# EAGLE design 572pv1 (EAGLE 6.4)
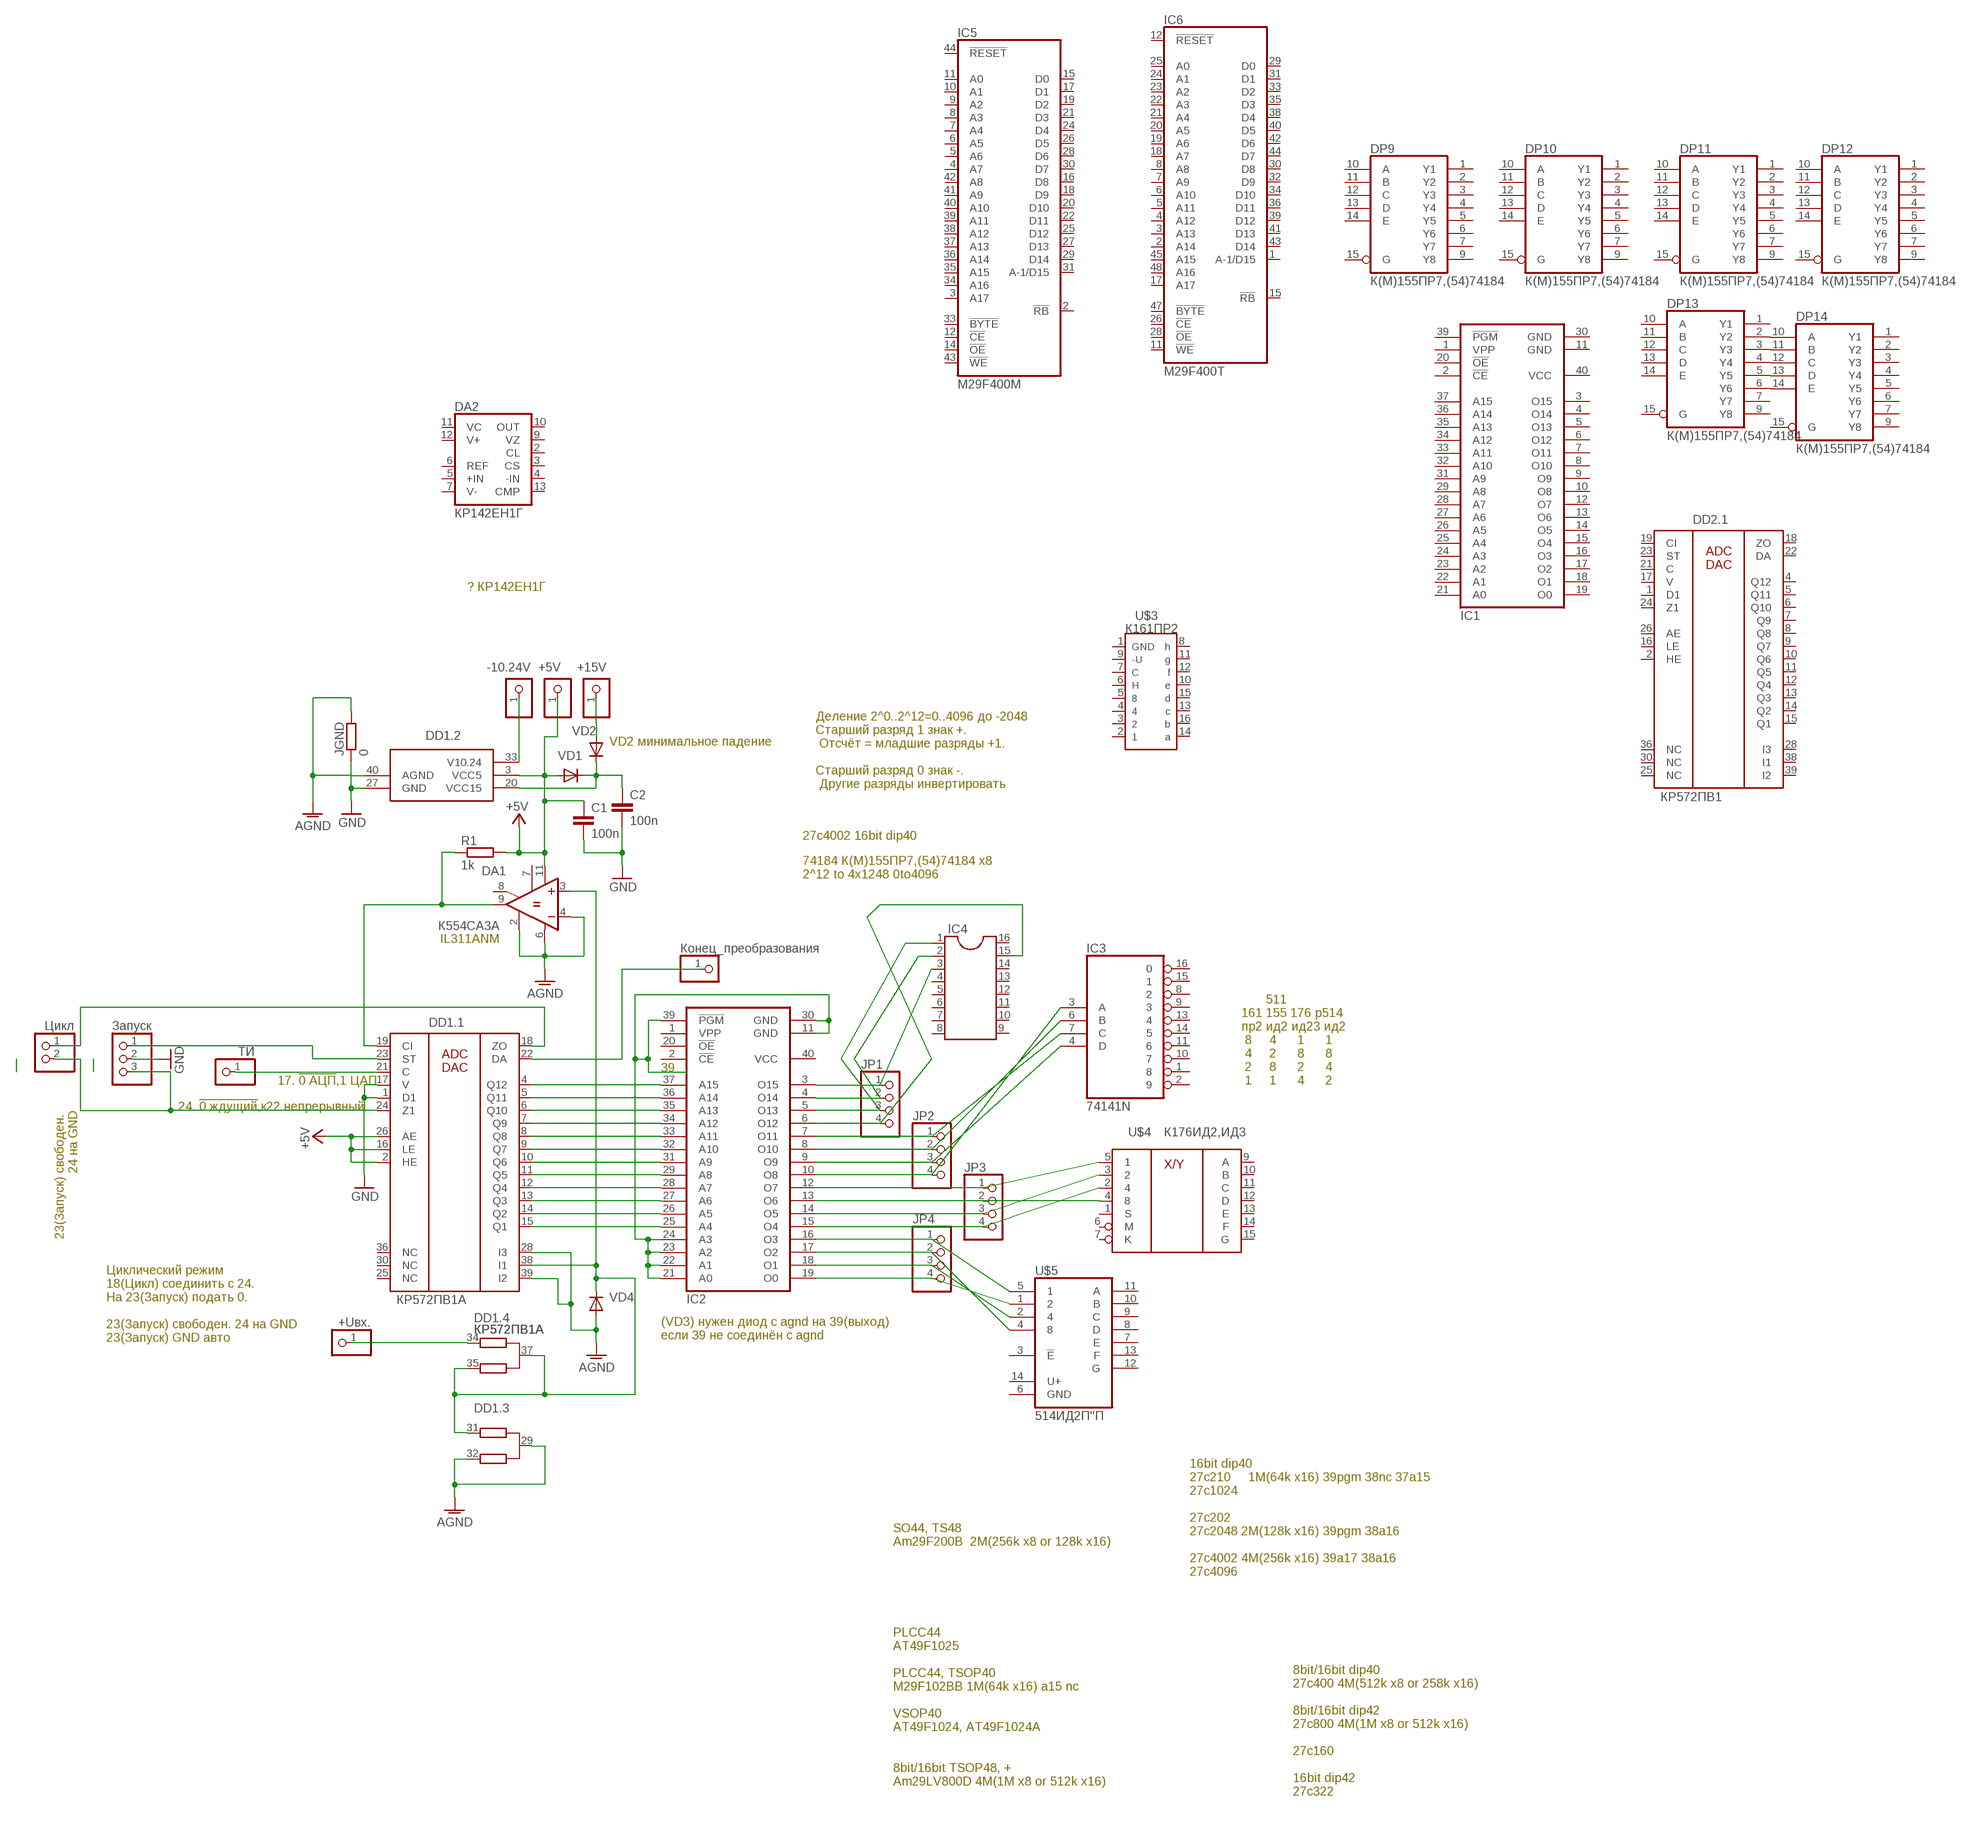
[diagram p0: schematic, sheet 1, part 1 of 2]
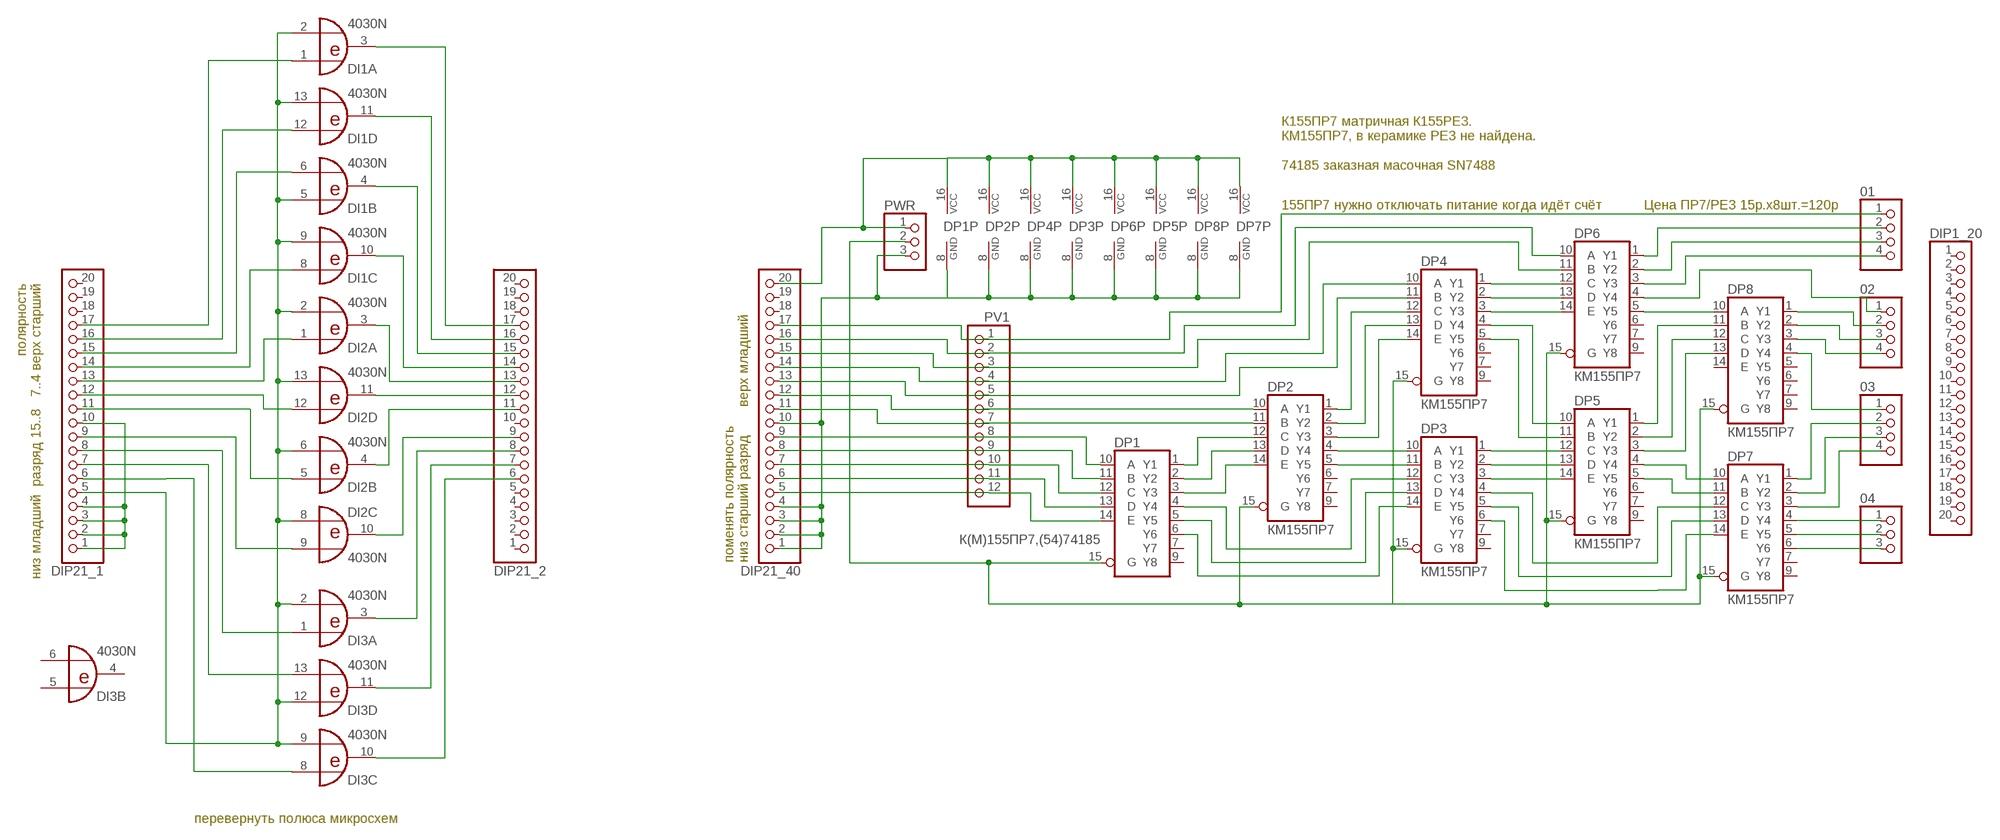
[diagram p1: schematic, sheet 1, part 2 of 2]

## Parts
01  PINHD-1X4  [1X04]
02  PINHD-1X4  [1X04]
03  PINHD-1X4  [1X04]
04  PINHD-1X3  [1X03]
+5V  PINHD-1X1  [1X01]
+15V  PINHD-1X1  [1X01]
+Uвх.  PINHD-1X1  [1X01]
-10.24V  PINHD-1X1  [1X01]
C1  100n  C-EUC0805  [C0805]
C2  100n  C-EUC0805  [C0805]
DA1  К554СА3А  LM311,К554СА3KY  [DIL14]
DA2  КР142ЕН1Г  UA723N  [DIL14]
DD1  КР572ПВ1А  КР572ПВ1  [DIL40]
DD2  КР572ПВ1  [DIL40]
DI1  4030N  [DIL14]
DI2  4030N  [DIL14]
DI3  4030N  [DIL14]
DIP1_20  PINHD-1X20  [1X20]
DIP21_1  PINHD-1X20  [1X20]
DIP21_2  PINHD-1X20  [1X20]
DIP21_40  PINHD-1X20  [1X20]
DP1  К(М)155ПР7,(54)74185  74184N  [DIL16]
DP2  КМ155ПР7  74184N  [DIL16]
DP3  КМ155ПР7  74184N  [DIL16]
DP4  КМ155ПР7  74184N  [DIL16]
DP5  КМ155ПР7  74184N  [DIL16]
DP6  КМ155ПР7  74184N  [DIL16]
DP7  КМ155ПР7  74184N  [DIL16]
DP8  КМ155ПР7  74184N  [DIL16]
DP9  К(М)155ПР7,(54)74184  74184N  [DIL16]
DP10  К(М)155ПР7,(54)74184  74184N  [DIL16]
DP11  К(М)155ПР7,(54)74184  74184N  [DIL16]
DP12  К(М)155ПР7,(54)74184  74184N  [DIL16]
DP13  К(М)155ПР7,(54)74184  74184N  [DIL16]
DP14  К(М)155ПР7,(54)74184  74184N  [DIL16]
IC1  27210  [DIL40]
IC2  27210  [DIL40]
IC3  74141N  [DIL16]
IC4  DIL16  [DIL16]
IC5  M29F400M  [SO44]
IC6  M29F400T  [TSOP48]
JGND  0  R-EU_R0805  [R0805]
JP1  PINHD-1X4  [1X04]
JP2  PINHD-1X4  [1X04]
JP3  PINHD-1X4  [1X04]
JP4  PINHD-1X4  [1X04]
PV1  PINHD-1X12  [1X12]
PWR  PINHD-1X3  [1X03]
R1  1k  R-EU_R0805  [R0805]
U$3  К161ПР2  [238.16-1]
U$4  К176ИД2,ИД3  [DIL16B]
U$5  514ИД2П''П  [238.14-1]
VD1  DIODE-SOD80C  [SOD80C]
VD2  DIODE-SOD80C  [SOD80C]
VD4  DIODE-SOD80C  [SOD80C]
Запуск  PINHD-1X3  [1X03]
Конец_преобразования  PINHD-1X1  [1X01]
ТИ  PINHD-1X1  [1X01]
Цикл  PINHD-1X2/2  [1X02]

## Nets
+5V: +5V.1 C1.1 DA1.11(V+) DD1.2(.1:HE) DD1.3(.2:VCC5) DD1.16(.1:LE) DD1.26(.1:AE) R1.2 VD1.A
AGND: DA1.2(GND) DA1.4(-IN) DA1.6(V-) DD1.28(.1:I3) DD1.29(.3:R2) DD1.32(.3:R1B) DD1.39(.1:I2) DD1.40(.2:AGND) JGND.2 VD4.A
GND: C1.2 C2.2 DD1.1(.1:D1) DD1.17(.1:V) DD1.27(.2:GND) JGND.1 Запуск.2
N$1: IC2.11(GND) IC2.21(A0) IC2.22(A1) IC2.23(A2) IC2.24(A3) IC2.30(GND) IC2.39(!PGM)
N$2: DD1.4(.1:Q12) IC2.37(A15)
N$3: C2.1 DD1.20(.2:VCC15) VD1.C VD2.C
N$4: DD1.5(.1:Q11) IC2.36(A14)
N$5: DD1.6(.1:Q10) IC2.35(A13)
N$6: DA1.3(+IN) DD1.31(.3:R1A) DD1.35(.4:R1B) DD1.37(.4:R2) DD1.38(.1:I1) VD4.C
N$7: DD1.7(.1:Q9) IC2.34(A12)
N$8: DD1.8(.1:Q8) IC2.33(A11)
N$9: DD1.9(.1:Q7) IC2.32(A10)
N$10: DD1.10(.1:Q6) IC2.31(A9)
N$11: DD1.11(.1:Q5) IC2.29(A8)
N$12: DD1.12(.1:Q4) IC2.28(A7)
N$13: DD1.13(.1:Q3) IC2.27(A6)
N$14: DD1.14(.1:Q2) IC2.26(A5)
N$15: DD1.15(.1:Q1) IC2.25(A4)
N$16: DIP21_40.9 DP1.10(A) PV1.8
N$17: DP13.2(Y2) DP14.10(A)
N$18: IC2.4(O14) IC4.2 JP1.2
N$19: IC2.3(O15) IC4.3 JP1.1
N$20: +Uвх..1 DD1.34(.4:R1A)
N$21: IC2.7(O11) IC3.7(C) JP2.1
N$22: IC2.8(O10) IC3.6(B) JP2.2
N$23: IC2.9(O9) IC3.4(D) JP2.3
N$24: IC2.10(O8) IC3.3(A) JP2.4
N$25: IC2.12(O7) JP3.1 U$4.5
N$26: IC2.13(O6) JP3.2 U$4.4
N$27: IC2.14(O5) JP3.3 U$4.3
N$28: IC2.15(O4) JP3.4 U$4.2
N$29: IC2.16(O3) JP4.1 U$5.5
N$30: IC2.17(O2) JP4.2 U$5.4
N$31: IC2.18(O1) JP4.3 U$5.2
N$32: IC2.19(O0) JP4.4 U$5.1
N$33: DIP21_40.8 DP1.11(B) PV1.9
N$34: DIP21_40.7 DP1.12(C) PV1.10
N$35: DIP21_40.6 DP1.13(D) PV1.11
N$36: DIP21_40.5 DP1.14(E) PV1.12
N$37: DP1.1(Y1) DP2.12(C)
N$38: DP1.2(Y2) DP2.13(D)
N$39: DP1.3(Y3) DP2.14(E)
N$40: DIP21_40.11 DP2.11(B) PV1.7
N$41: DIP21_40.12 DP2.10(A) PV1.6
N$42: DP2.4(Y4) DP3.10(A)
N$43: DP2.5(Y5) DP3.11(B)
N$44: DP1.4(Y4) DP3.12(C)
N$45: DP1.5(Y5) DP3.13(D)
N$46: DP1.6(Y6) DP3.14(E)
N$47: DP2.3(Y3) DP4.14(E)
N$48: DP2.2(Y2) DP4.13(D)
N$49: DP2.1(Y1) DP4.12(C)
N$50: DIP21_40.13 DP4.11(B) PV1.5
N$51: DIP21_40.14 DP4.10(A) PV1.4
N$52: DP3.1(Y1) DP5.12(C)
N$53: DP3.2(Y2) DP5.13(D)
N$54: DP3.3(Y3) DP5.14(E)
N$55: DP4.5(Y5) DP5.11(B)
N$56: DP4.4(Y4) DP5.10(A)
N$57: DP4.3(Y3) DP6.14(E)
N$58: DP4.2(Y2) DP6.13(D)
N$59: DP4.1(Y1) DP6.12(C)
N$60: DP3.4(Y4) DP7.12(C)
N$61: DP3.5(Y5) DP7.13(D)
N$62: DP3.6(Y6) DP7.14(E)
N$63: DP5.3(Y3) DP8.13(D)
N$64: DP5.5(Y5) DP7.11(B)
N$65: DP5.4(Y4) DP7.10(A)
N$66: DP5.1(Y1) DP8.11(B)
N$67: DP5.2(Y2) DP8.12(C)
N$68: DP6.5(Y5) DP8.10(A)
N$69: 04.1 DP7.4(Y4)
N$70: 04.2 DP7.5(Y5)
N$71: 04.3 DP7.6(Y6)
N$72: 03.2 DP7.1(Y1)
N$73: 03.3 DP7.2(Y2)
N$74: 03.4 DP7.3(Y3)
N$75: 03.1 DP8.4(Y4)
N$76: 02.3 DP8.2(Y2)
N$77: 02.2 DP8.1(Y1)
N$78: 02.4 DP8.3(Y3)
N$79: DIP21_40.15 DP6.11(B) PV1.3
N$80: DIP21_40.16 DP6.10(A) PV1.2
N$81: 01.1 DIP21_40.17 PV1.1
N$82: 02.1 DP6.4(Y4)
N$83: 01.4 DP6.3(Y3)
N$84: 01.3 DP6.2(Y2)
N$85: 01.2 DP6.1(Y1)
N$86: DIP21_40.1 DIP21_40.2 DIP21_40.3 DIP21_40.4 DIP21_40.10 DP1.8(GND) DP2.8(GND) DP3.8(GND) DP4.8(GND) DP5.8(GND) DP6.8(GND) DP7.8(GND) DP8.8(GND) PWR.3
N$87: DP1.15(G) DP2.15(G) DP3.15(G) DP4.15(G) DP5.15(G) DP6.15(G) DP7.15(G) DP8.15(G) PWR.2
N$88: -10.24V.1 DD1.33(.2:V10.24)
N$89: IC2.6(O12) IC4.15 JP1.4
N$90: DIP21_40.20 DP1.16(VCC) DP2.16(VCC) DP3.16(VCC) DP4.16(VCC) DP5.16(VCC) DP6.16(VCC) DP7.16(VCC) DP8.16(VCC) PWR.1
N$91: IC2.5(O13) IC4.1 JP1.3
N$92: DD1.23(.1:ST) Запуск.1
N$93: DA1.9(OUT) DD1.19(.1:CI) R1.1
N$94: DD1.21(.1:C) ТИ.1
N$95: DD1.22(.1:DA) Конец_преобразования.1
N$96: DP13.3(Y3) DP14.11(B)
N$97: +15V.1 VD2.A
N$98: DP13.4(Y4) DP14.12(C)
N$99: DD1.24(.1:Z1) Запуск.3 Цикл.2
N$101: DD1.18(.1:ZO) Цикл.1
N$102: DP13.5(Y5) DP14.13(D)
N$103: DP13.6(Y6) DP14.14(E)
N$104: DI2.11(D:O) DIP21_2.12
N$105: DI2.12(D:I0) DIP21_1.12
N$106: DI2.5(B:I0) DIP21_1.11
N$107: DI1.8(C:I0) DIP21_1.14
N$108: DI1.6(B:I1) DIP21_1.15
N$109: DI1.12(D:I0) DIP21_1.16
N$110: DI1.1(A:I0) DIP21_1.17
N$111: DI2.9(C:I1) DIP21_1.9
N$112: DI3.1(A:I0) DIP21_1.8
N$113: DI3.13(D:I1) DIP21_1.7
N$114: DI3.8(C:I0) DIP21_1.6
N$115: DI2.3(A:O) DIP21_2.13
N$116: DI2.1(A:I0) DIP21_1.13
N$117: DIP21_1.1 DIP21_1.2 DIP21_1.3 DIP21_1.4 DIP21_1.10
N$118: DI1.2(A:I1) DI1.5(B:I0) DI1.9(C:I1) DI1.13(D:I1) DI2.2(A:I1) DI2.6(B:I1) DI2.8(C:I0) DI2.13(D:I1) DI3.2(A:I1) DI3.9(C:I1) DI3.12(D:I0) DIP21_1.5
N$119: DI1.10(C:O) DIP21_2.14
N$120: DI1.4(B:O) DIP21_2.15
N$121: DI1.11(D:O) DIP21_2.16
N$122: DI1.3(A:O) DIP21_2.17
N$123: DI2.4(B:O) DIP21_2.11
N$124: DI2.10(C:O) DIP21_2.9
N$125: DI3.3(A:O) DIP21_2.8
N$126: DI3.11(D:O) DIP21_2.7
N$127: DI3.10(C:O) DIP21_2.6
Unconnected: DA1.7(ON) DA1.8(ON/STR) DA2.2(CL) DA2.3(CS) DA2.4(-IN) DA2.5(+IN) DA2.6(REF) DA2.7(V-) DA2.9(VZ) DA2.10(OUT) DA2.11(VC) DA2.12(V+) DA2.13(CMP) DD1.25(.1:NC) DD1.30(.1:NC) DD1.36(.1:NC) DD2.1(.1:D1) DD2.2(.1:HE) DD2.4(.1:Q12) DD2.5(.1:Q11) DD2.6(.1:Q10) DD2.7(.1:Q9) DD2.8(.1:Q8) DD2.9(.1:Q7) DD2.10(.1:Q6) DD2.11(.1:Q5) DD2.12(.1:Q4) DD2.13(.1:Q3) DD2.14(.1:Q2) DD2.15(.1:Q1) DD2.16(.1:LE) DD2.17(.1:V) DD2.18(.1:ZO) DD2.19(.1:CI) DD2.21(.1:C) DD2.22(.1:DA) DD2.23(.1:ST) DD2.24(.1:Z1) DD2.25(.1:NC) DD2.26(.1:AE) DD2.28(.1:I3) DD2.29(.3:R2) DD2.30(.1:NC) DD2.31(.3:R1A) DD2.32(.3:R1B) DD2.34(.4:R1A) DD2.35(.4:R1B) DD2.36(.1:NC) DD2.37(.4:R2) DD2.38(.1:I1) DD2.39(.1:I2) DI3.4(B:O) DI3.5(B:I0) DI3.6(B:I1) DIP1_20.1 DIP1_20.2 DIP1_20.3 DIP1_20.4 DIP1_20.5 DIP1_20.6 DIP1_20.7 DIP1_20.8 DIP1_20.9 DIP1_20.10 DIP1_20.11 DIP1_20.12 DIP1_20.13 DIP1_20.14 DIP1_20.15 DIP1_20.16 DIP1_20.17 DIP1_20.18 DIP1_20.19 DIP1_20.20 DIP21_1.18 DIP21_1.19 DIP21_1.20 DIP21_2.1 DIP21_2.2 DIP21_2.3 DIP21_2.4 DIP21_2.5 DIP21_2.10 DIP21_2.18 DIP21_2.19 DIP21_2.20 DIP21_40.18 DIP21_40.19 DP1.7(Y7) DP1.9(Y8) DP2.6(Y6) DP2.7(Y7) DP2.9(Y8) DP3.7(Y7) DP3.9(Y8) DP4.6(Y6) DP4.7(Y7) DP4.9(Y8) DP5.6(Y6) DP5.7(Y7) DP5.9(Y8) DP6.6(Y6) DP6.7(Y7) DP6.9(Y8) DP7.7(Y7) DP7.9(Y8) DP8.5(Y5) DP8.6(Y6) DP8.7(Y7) DP8.9(Y8) DP8.14(E) DP9.1(Y1) DP9.2(Y2) DP9.3(Y3) DP9.4(Y4) DP9.5(Y5) DP9.6(Y6) DP9.7(Y7) DP9.9(Y8) DP9.10(A) DP9.11(B) DP9.12(C) DP9.13(D) DP9.14(E) DP9.15(G) DP10.1(Y1) DP10.2(Y2) DP10.3(Y3) DP10.4(Y4) DP10.5(Y5) DP10.6(Y6) DP10.7(Y7) DP10.9(Y8) DP10.10(A) DP10.11(B) DP10.12(C) DP10.13(D) DP10.14(E) DP10.15(G) DP11.1(Y1) DP11.2(Y2) DP11.3(Y3) DP11.4(Y4) DP11.5(Y5) DP11.6(Y6) DP11.7(Y7) DP11.9(Y8) DP11.10(A) DP11.11(B) DP11.12(C) DP11.13(D) DP11.14(E) DP11.15(G) DP12.1(Y1) DP12.2(Y2) DP12.3(Y3) DP12.4(Y4) DP12.5(Y5) DP12.6(Y6) DP12.7(Y7) DP12.9(Y8) DP12.10(A) DP12.11(B) DP12.12(C) DP12.13(D) DP12.14(E) DP12.15(G) DP13.1(Y1) DP13.7(Y7) DP13.9(Y8) DP13.10(A) DP13.11(B) DP13.12(C) DP13.13(D) DP13.14(E) DP13.15(G) DP14.1(Y1) DP14.2(Y2) DP14.3(Y3) DP14.4(Y4) DP14.5(Y5) DP14.6(Y6) DP14.7(Y7) DP14.9(Y8) DP14.15(G) IC1.1(VPP) IC1.2(!CE) IC1.3(O15) IC1.4(O14) IC1.5(O13) IC1.6(O12) IC1.7(O11) IC1.8(O10) IC1.9(O9) IC1.10(O8) IC1.12(O7) IC1.13(O6) IC1.14(O5) IC1.15(O4) IC1.16(O3) IC1.17(O2) IC1.18(O1) IC1.19(O0) IC1.20(!OE) IC1.21(A0) IC1.22(A1) IC1.23(A2) IC1.24(A3) IC1.25(A4) IC1.26(A5) IC1.27(A6) IC1.28(A7) IC1.29(A8) IC1.31(A9) IC1.32(A10) IC1.33(A11) IC1.34(A12) IC1.35(A13) IC1.36(A14) IC1.37(A15) IC1.39(!PGM) IC2.1(VPP) IC2.2(!CE) IC2.20(!OE) IC3.1 IC3.2 IC3.8 IC3.9 IC3.10 IC3.11 IC3.13 IC3.14 IC3.15 IC3.16 IC4.4 IC4.5 IC4.6 IC4.7 IC4.8 IC4.9 IC4.10 IC4.11 IC4.12 IC4.13 IC4.14 IC4.16 IC5.1(NC) IC5.2(!RB) IC5.3(A17) IC5.4(A7) IC5.5(A6) IC5.6(A5) IC5.7(A4) IC5.8(A3) IC5.9(A2) IC5.10(A1) IC5.11(A0) IC5.12(!CE) IC5.14(!OE) IC5.15(D0) IC5.16(D8) IC5.17(D1) IC5.18(D9) IC5.19(D2) IC5.20(D10) IC5.21(D3) IC5.22(D11) IC5.24(D4) IC5.25(D12) IC5.26(D5) IC5.27(D13) IC5.28(D6) IC5.29(D14) IC5.30(D7) IC5.31(A-1/D15) IC5.33(!BYTE) IC5.34(A16) IC5.35(A15) IC5.36(A14) IC5.37(A13) IC5.38(A12) IC5.39(A11) IC5.40(A10) IC5.41(A9) IC5.42(A8) IC5.43(!WE) IC5.44(!RESET) IC6.1(A-1/D15) IC6.2(A14) IC6.3(A13) IC6.4(A12) IC6.5(A11) IC6.6(A10) IC6.7(A9) IC6.8(A8) IC6.9(NC) IC6.10(NC) IC6.11(!WE) IC6.12(!RESET) IC6.13(NC) IC6.14(NC) IC6.15(!RB) IC6.16(NC) IC6.17(A17) IC6.18(A7) IC6.19(A6) IC6.20(A5) IC6.21(A4) IC6.22(A3) IC6.23(A2) IC6.24(A1) IC6.25(A0) IC6.26(!CE) IC6.28(!OE) IC6.29(D0) IC6.30(D8) IC6.31(D1) IC6.32(D9) IC6.33(D2) IC6.34(D10) IC6.35(D3) IC6.36(D11) IC6.38(D4) IC6.39(D12) IC6.40(D5) IC6.41(D13) IC6.42(D6) IC6.43(D14) IC6.44(D7) IC6.45(A15) IC6.47(!BYTE) IC6.48(A16) U$3.2 U$3.3 U$3.4 U$3.5 U$3.6(HIN) U$3.7(СC) U$3.8(H) U$3.10(E) U$3.11(G) U$3.12(F) U$3.13(C) U$3.14(A) U$3.15(D) U$3.16(B) U$4.1(S) U$4.6(M) U$4.7(K) U$4.9(A) U$4.10(B) U$4.11(C) U$4.12(D) U$4.13(E) U$4.14(F) U$4.15(G) U$5.3(!E) U$5.6(GND) U$5.7(E) U$5.8(D) U$5.9(C) U$5.10(B) U$5.11(A) U$5.12(G) U$5.13(F) U$5.14(U+)

## Notes on the sheet
- ? КР142ЕН1Г
- VD2 минимальное падение
- Деление 2^0..2^12=0..4096 до -2048
  Старший разряд 1 знак +. 
   Отсчёт = младшие разряды +1.
  
  Старший разряд 0 знак -. 
   Другие разряды инвертировать
- 27c4002 16bit dip40
- 74184 К(М)155ПР7,(54)74184 x8
  2^12 to 4x1248 0to4096
- IL311ANM
- 511
  161 155 176 р514 
  пр2 ид2 ид23 ид2 
   8     4      1      1  
   4     2      8      8  
   2     8      2      4 
   1     1      4      2
- 39
- 17. !0 АЦП!,1 ЦАП
- 23(Запуск) свободен. 
  24 на GND
- 24. !0 ждущий!,к22 непрерывный
- (VD3) нужен диод с agnd на 39(выход)
  если 39 не соединён с agnd
- Циклический режим
  18(Цикл) соединить с 24.
  На 23(Запуск) подать 0.
  
  23(Запуск) свободен. 24 на GND
  23(Запуск) GND авто
- 16bit dip40
  27c210     1M(64k x16) 39pgm 38nc 37a15
  27c1024
  
  27c202
  27c2048 2M(128k x16) 39pgm 38a16
  
  27c4002 4M(256k x16) 39a17 38a16
  27c4096
- К155ПР7 матричная К155РЕ3.
  КМ155ПР7, в керамике РЕ3 не найдена.
  
  74185 заказная масочная SN7488
- SO44, TS48
  Am29F200B  2M(256k x8 or 128k x16)
- 155ПР7 нужно отключать питание когда идёт счёт | Цена ПР7/РЕ3 15р.х8шт.=120р
- PLCC44
  AT49F1025
  
  PLCC44, TSOP40
  M29F102BB 1M(64k x16) a15 nc
  
  VSOP40
  AT49F1024, AT49F1024A
   
  
  8bit/16bit TSOP48, +
  Am29LV800D 4M(1M x8 or 512k x16)
- 8bit/16bit dip40
  27c400 4M(512k x8 or 258k x16) 
  
  8bit/16bit dip42
  27c800 4M(1M x8 or 512k x16) 
  
  27c160
  
  16bit dip42
  27c322
- полярность
  низ младший  разряд 15..8   7..4 верх старший
- поменять полярность
  низ старший разряд       верх младший
- перевернуть полюса микросхем

## Power pins joined to a net without a drawn wire
-VCC: U$3.9(-VCC)
AGND: DD2.40(.2:AGND)
GND: DD2.27(.2:GND) DP9.8(GND) DP10.8(GND) DP11.8(GND) DP12.8(GND) DP13.8(GND) DP14.8(GND) IC1.11(GND) IC1.30(GND) IC3.12(GND) IC5.13(GND) IC5.32(GND) IC6.27(GND) IC6.46(GND) U$3.1(GND) U$4.8(GND)
V10.24: DD2.33(.2:V10.24)
VCC: DP9.16(VCC) DP10.16(VCC) DP11.16(VCC) DP12.16(VCC) DP13.16(VCC) DP14.16(VCC) IC1.40(VCC) IC2.40(VCC) IC3.5(VCC) IC5.23(VCC) IC6.37(VCC) U$4.16(VCC)
VCC5: DD2.3(.2:VCC5)
VCC15: DD2.20(.2:VCC15)
VDD: DI1.14(P:VDD) DI2.14(P:VDD) DI3.14(P:VDD)
VSS: DI1.7(P:VSS) DI2.7(P:VSS) DI3.7(P:VSS)

## Library data of the parts
01-03 JP1-JP4 = Разъёмы штырьковые 2.54мм:PINHD-1X4: PIN HEADER
04 PWR Запуск = Разъёмы штырьковые 2.54мм:PINHD-1X3: PIN HEADER
+5V +15V +Uвх. -10.24V Конец_преобразования ТИ = Разъёмы штырьковые 2.54мм:PINHD-1X1: PIN HEADER
C1 C2 = rcl:C-EU: CAPACITOR, European symbol
DA1 = IC:LM311,К554СА3: COMPARATOR
DA2 = linear:*723: Positive VOLTAGE REGULATOR
DD1 DD2 = 572:КР572ПВ1
DI1-DI3 = 40xx:4030: Quad XOR
DIP1_20 DIP21_1 DIP21_2 DIP21_40 = Разъёмы штырьковые 2.54мм:PINHD-1X20: PIN HEADER
DP1-DP8 = 74xx-eu:74*184: BCD to binary and binary to BCD CONVERTER
DP9-DP14 = 74xx-us:74*184: BCD to binary and binary to BCD CONVERTER
IC1 IC2 = memory:27210: MEMORY
IC3 = 74xx-us:74*141: BCD to decimal DECODER/DRIVER
IC4 = ic-package:DIL16: Dual In Line / Socket
IC5 = st-microelectronics:M29F400M: FLASH MEMORY 512 KB x 8 or 256 KB x 16, boot block; MF: SPANSION LLC; MPN: AM29F400BB-90SF; OC_FARNELL: 1607577; OC_NEWARK: 58K5516
IC6 = st-microelectronics:M29F400T: FLASH MEMORY 512 KB x 8 or 256 KB x 16, boot block; MPN: MBM29F400TC-70PFTN-SFLE1; OC_FARNELL: 1201518; OC_NEWARK: 89M1908
JGND R1 = rcl:R-EU_: RESISTOR, European symbol
PV1 = Разъёмы штырьковые 2.54мм:PINHD-1X12: PIN HEADER
U$3 = КР1534,К161,К120:К161ПР2
U$4 = К176:К176ИД2,ИД3
U$5 = 514:514ИД2П
VD1 VD2 VD4 = diode:DIODE-: DIODE
Цикл = Разъёмы штырьковые 2.54мм:PINHD-1X2: PIN HEADER

## Board
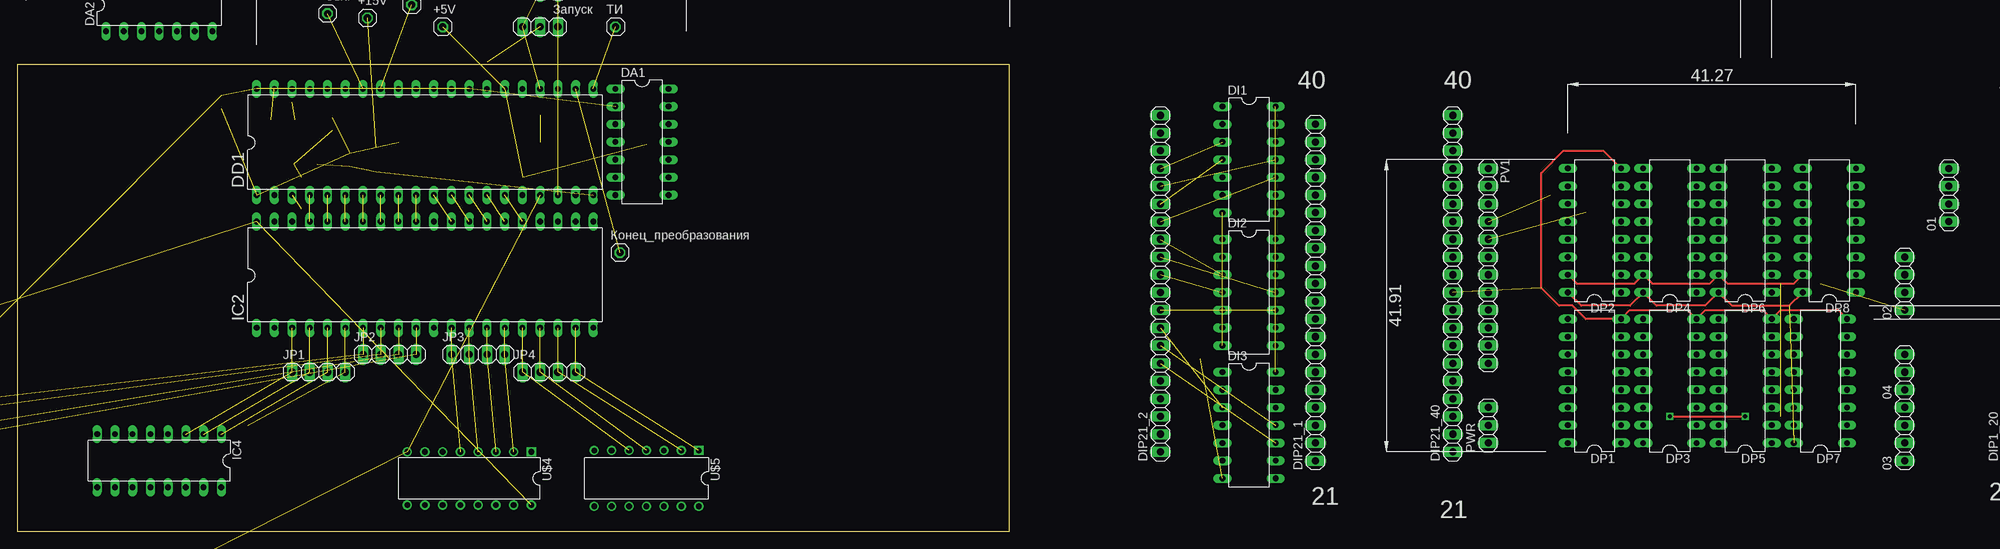
[diagram p2: board, top side]
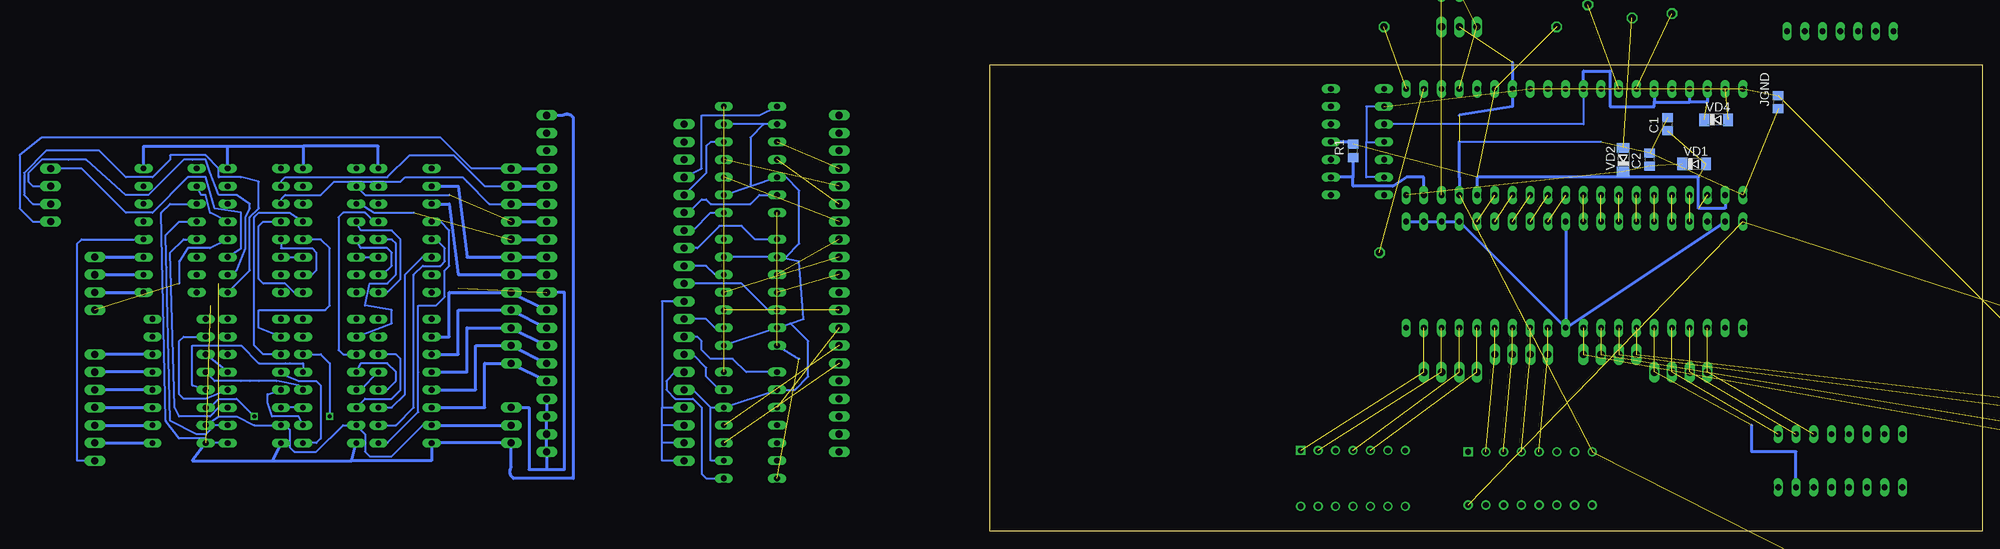
[diagram p3: board, bottom side, seen from below]

Size 142.22 x 66.98 mm. Coordinates in mm from the lower left corner, seen from the top.
Outline: 0,0 142.22,0 142.22,66.98 0,66.98 0,0
Copper layers (1*16): Top 0.035mm / dielectric 1.5mm / Bottom 0.035mm
Design rules "default": minimum track width 10mil, minimum drill 24mil, track to track 8mil, track to pad 8mil, pad to pad 8mil, via to via 8mil, smd to smd 8mil, copper to edge 40mil, drill to drill 8mil, minimum pad ring 10mil, minimum via ring 8mil, stop-mask expansion 4mil, vias tented up to drill 0mil, thermal gap 10mil

### Footprints (pad centres in the part's own frame; a part is rotated, then mirrored left to right if it is on the bottom)
1X04 = drill 1.016 long: 1 -3.81,0; 2 -1.27,0; 3 1.27,0; 4 3.81,0
1X03 = drill 1.016 long: 1 -2.54,0; 2 0,0; 3 2.54,0
1X01 = drill 1.016 octagon: 1 0,0
C0805 = smd 1.3 x 1.5: 1 -0.95,0; 2 0.95,0
DIL14 = drill 0.813 long: 1 -7.62,-3.81; 2 -5.08,-3.81; 3 -2.54,-3.81; 4 0,-3.81; 5 2.54,-3.81; 6 5.08,-3.81; 7 7.62,-3.81; 8 7.62,3.81; 9 5.08,3.81; 10 2.54,3.81; 11 0,3.81; 12 -2.54,3.81; 13 -5.08,3.81; 14 -7.62,3.81
DIL40 = drill 0.813 long: 1 -24.13,-7.62; 2 -21.59,-7.62; 3 -19.05,-7.62; 4 -16.51,-7.62; 5 -13.97,-7.62; 6 -11.43,-7.62; 7 -8.89,-7.62; 8 -6.35,-7.62; 9 -3.81,-7.62; 10 -1.27,-7.62; 11 1.27,-7.62; 12 3.81,-7.62; 13 6.35,-7.62; 14 8.89,-7.62; 15 11.43,-7.62; 16 13.97,-7.62; 17 16.51,-7.62; 18 19.05,-7.62; 19 21.59,-7.62; 20 24.13,-7.62; 21 24.13,7.62; 22 21.59,7.62; 23 19.05,7.62; 24 16.51,7.62; 25 13.97,7.62; 26 11.43,7.62; 27 8.89,7.62; 28 6.35,7.62; 29 3.81,7.62; 30 1.27,7.62; 31 -1.27,7.62; 32 -3.81,7.62; 33 -6.35,7.62; 34 -8.89,7.62; 35 -11.43,7.62; 36 -13.97,7.62; 37 -16.51,7.62; 38 -19.05,7.62; 39 -21.59,7.62; 40 -24.13,7.62
1X20 = drill 1.016 long: 1 -24.13,0; 2 -21.59,0; 3 -19.05,0; 4 -16.51,0; 5 -13.97,0; 6 -11.43,0; 7 -8.89,0; 8 -6.35,0; 9 -3.81,0; 10 -1.27,0; 11 1.27,0; 12 3.81,0; 13 6.35,0; 14 8.89,0; 15 11.43,0; 16 13.97,0; 17 16.51,0; 18 19.05,0; 19 21.59,0; 20 24.13,0
DIL16 = drill 0.813 long: 1 -8.89,-3.81; 2 -6.35,-3.81; 3 -3.81,-3.81; 4 -1.27,-3.81; 5 1.27,-3.81; 6 3.81,-3.81; 7 6.35,-3.81; 8 8.89,-3.81; 9 8.89,3.81; 10 6.35,3.81; 11 3.81,3.81; 12 1.27,3.81; 13 -1.27,3.81; 14 -3.81,3.81; 15 -6.35,3.81; 16 -8.89,3.81
SO44 = smd 0.6 x 2.2: 1 -13.335,-7.34; 2 -12.065,-7.34; 3 -10.795,-7.34; 4 -9.525,-7.34; 5 -8.255,-7.34; 6 -6.985,-7.34; 7 -5.715,-7.34; 8 -4.445,-7.34; 9 -3.175,-7.34; 10 -1.905,-7.34; 11 -0.635,-7.34; 12 0.635,-7.34; 13 1.905,-7.34; 14 3.175,-7.34; 15 4.445,-7.34; 16 5.715,-7.34; 17 6.985,-7.34; 18 8.255,-7.34; 19 9.525,-7.34; 20 10.795,-7.34; 21 12.065,-7.34; 22 13.335,-7.34; 23 13.335,7.34; 24 12.065,7.34; 25 10.795,7.34; 26 9.525,7.34; 27 8.255,7.34; 28 6.985,7.34; 29 5.715,7.34; 30 4.445,7.34; 31 3.175,7.34; 32 1.905,7.34; 33 0.635,7.34; 34 -0.635,7.34; 35 -1.905,7.34; 36 -3.175,7.34; 37 -4.445,7.34; 38 -5.715,7.34; 39 -6.985,7.34; 40 -8.255,7.34; 41 -9.525,7.34; 42 -10.795,7.34; 43 -12.065,7.34; 44 -13.335,7.34
TSOP48 = smd 0.3 x 1.6: 1 -5.75,-9.6; 2 -5.25,-9.6; 3 -4.75,-9.6; 4 -4.25,-9.6; 5 -3.75,-9.6; 6 -3.25,-9.6; 7 -2.75,-9.6; 8 -2.25,-9.6; 9 -1.75,-9.6; 10 -1.25,-9.6; 11 -0.75,-9.6; 12 -0.25,-9.6; 13 0.25,-9.6; 14 0.75,-9.6; 15 1.25,-9.6; 16 1.75,-9.6; 17 2.25,-9.6; 18 2.75,-9.6; 19 3.25,-9.6; 20 3.75,-9.6; 21 4.25,-9.6; 22 4.75,-9.6; 23 5.25,-9.6; 24 5.75,-9.6; 25 5.75,9.6; 26 5.25,9.6; 27 4.75,9.6; 28 4.25,9.6; 29 3.75,9.6; 30 3.25,9.6; 31 2.75,9.6; 32 2.25,9.6; 33 1.75,9.6; 34 1.25,9.6; 35 0.75,9.6; 36 0.25,9.6; 37 -0.25,9.6; 38 -0.75,9.6; 39 -1.25,9.6; 40 -1.75,9.6; 41 -2.25,9.6; 42 -2.75,9.6; 43 -3.25,9.6; 44 -3.75,9.6; 45 -4.25,9.6; 46 -4.75,9.6; 47 -5.25,9.6; 48 -5.75,9.6
R0805 = smd 1.3 x 1.5: 1 -0.95,0; 2 0.95,0
1X12 = drill 1.016 long: 1 -13.97,0; 2 -11.43,0; 3 -8.89,0; 4 -6.35,0; 5 -3.81,0; 6 -1.27,0; 7 1.27,0; 8 3.81,0; 9 6.35,0; 10 8.89,0; 11 11.43,0; 12 13.97,0
238.16-1 = drill 0.9 square: 1 -8.75,-3.75 | drill 0.9: 2 -6.25,-3.75; 3 -3.75,-3.75; 4 -1.25,-3.75; 5 1.25,-3.75; 6 3.75,-3.75; 7 6.25,-3.75; 8 8.75,-3.75; 9 8.75,3.75; 10 6.25,3.75; 11 3.75,3.75; 12 1.25,3.75; 13 -1.25,3.75; 14 -3.75,3.75; 15 -6.25,3.75; 16 -8.75,3.75
DIL16B = drill 0.813 square: 1 -8.89,-3.81 | drill 0.813: 2 -6.35,-3.81; 3 -3.81,-3.81; 4 -1.27,-3.81; 5 1.27,-3.81; 6 3.81,-3.81; 7 6.35,-3.81; 8 8.89,-3.81; 9 8.89,3.81; 10 6.35,3.81; 11 3.81,3.81; 12 1.27,3.81; 13 -1.27,3.81; 14 -3.81,3.81; 15 -6.35,3.81; 16 -8.89,3.81
238.14-1 = drill 0.8 square: 1 -7.5,-4 | drill 0.8: 2 -5,-4; 3 -2.5,-4; 4 0,-4; 5 2.5,-4; 6 5,-4; 7 7.5,-4; 8 7.5,4; 9 5,4; 10 2.5,4; 11 0,4; 12 -2.5,4; 13 -5,4; 14 -7.5,4
SOD80C = smd 1.4 x 1.8: A 1.7,0; C -1.7,0
1X02 = drill 1.016 long: 1 -1.27,0; 2 1.27,0

### Placement (x,y rotation side)
01  276.86,48.26 90 top  (outside the outline)
02  270.51,35.56 90 top  (outside the outline)
03  270.51,13.97 90 top  (outside the outline)
04  270.51,22.86 90 top  (outside the outline)
+5V  60.96,72.39 0 top  (outside the outline)
+15V  50.16,73.66 0 top  (outside the outline)
+Uвх.  44.45,74.3 0 top  (outside the outline)
-10.24V  56.52,75.56 0 top  (outside the outline)
C1  45.09,58.42 90 bottom
C2  47.62,53.34 90 bottom
DA1  89.53,55.88 270 top
DA2  20.32,75.56 0 top  (outside the outline)
DD1  58.42,55.88 0 top
DD2  -116.2,-51.44 180 top  (outside the outline)
DI1  176.53,53.34 270 top  (outside the outline)
DI2  176.53,34.29 270 top  (outside the outline)
DI3  176.53,15.24 270 top  (outside the outline)
DIP1_20  285.75,35.56 90 top  (outside the outline)
DIP21_1  186.06,34.29 90 top  (outside the outline)
DIP21_2  163.83,35.56 90 top  (outside the outline)
DIP21_40  205.74,35.56 90 top  (outside the outline)
DP1  226.06,21.59 90 top  (outside the outline)
DP2  226.06,43.18 90 top  (outside the outline)
DP3  236.85,21.59 90 top  (outside the outline)
DP4  236.85,43.18 90 top  (outside the outline)
DP5  247.65,21.59 90 top  (outside the outline)
DP6  247.65,43.18 90 top  (outside the outline)
DP7  258.44,21.59 90 top  (outside the outline)
DP8  259.71,43.18 90 top  (outside the outline)
DP9  -184.78,-70.48 180 top  (outside the outline)
DP10  -208.28,-70.48 180 top  (outside the outline)
DP11  -182.25,-85.72 180 top  (outside the outline)
DP12  -205.1,-86.36 180 top  (outside the outline)
DP13  -208.28,-98.42 180 top  (outside the outline)
DP14  -182.88,-98.42 180 top  (outside the outline)
IC1  -54.61,-51.44 0 top  (outside the outline)
IC2  58.42,36.83 0 top
IC3  -94.61,2.54 90 top  (outside the outline)
IC4  20.32,10.16 180 top
IC5  -127,-70.48 0 top  (outside the outline)
IC6  -124.46,-51.44 90 top  (outside the outline)
JGND  29.21,61.59 90 bottom
JP1  43.18,22.86 0 top
JP2  53.34,25.4 0 top
JP3  66.04,25.4 0 top
JP4  76.2,22.86 0 top
PV1  210.82,38.1 270 top  (outside the outline)
PWR  210.82,15.24 90 top  (outside the outline)
R1  90.17,54.61 90 bottom
U$3  -99.69,-69.85 0 top  (outside the outline)
U$4  64.77,7.62 180 top
U$5  90.17,7.62 180 top
VD1  41.27,52.7 0 bottom
VD2  51.44,53.34 90 bottom
VD4  38.1,59.05 0 bottom
Запуск  74.93,72.39 180 top  (outside the outline)
Конец_преобразования  86.36,40.01 0 top
ТИ  85.72,72.39 0 top  (outside the outline)
Цикл  76.2,77.47 180 top  (outside the outline)

### Tracks (layer width: path | path; a pad name or v marks a point on that pad's centre or on a via)
+5V  (6 unrouted)
  Bottom 0.406: R1.2 90.17,55.88 DA1.11 | DD1.2 36.83,46.35 40.64,46.35 40.64,50.8 72.39,50.8 DD1.16
AGND  (8 unrouted)
  Bottom 0.305: DA1.2 88.27,60.96 88.27,55.88 | 88.27,55.88 DA1.4 | DA1.6 88.27,50.8 88.27,55.88
GND  (22 unrouted)
  Bottom 0.305: 54.61,55.88 74.93,55.88
  Bottom 0.406: DD1.17 74.93,50.8 74.93,55.88 | 67.31,67.31 DD1.27 67.31,60.96 74.93,59.69
N$1
  Bottom 0.406: IC2.30 IC2.11 | IC2.21 IC2.22 IC2.23 IC2.24 IC2.11 | IC2.39 IC2.11
N$2  (1 unrouted)
N$3  (3 unrouted)
N$4  (1 unrouted)
N$5  (1 unrouted)
N$6  (1 unrouted)
  Bottom 0.305: DD1.31 57.15,58.42 DA1.3
  Bottom 0.406: DD1.38 39.37,61.59 41.91,61.59 | 41.91,61.59 DD1.37 | DD1.35 46.99,61.59 | 46.99,61.59 41.91,61.59 | DD1.31 57.15,66.04 53.34,66.04 53.34,60.96 46.99,60.96 46.99,61.59
N$7  (1 unrouted)
N$8  (1 unrouted)
N$9  (1 unrouted)
N$10  (1 unrouted)
N$11  (1 unrouted)
N$12  (1 unrouted)
N$13  (1 unrouted)
N$14  (1 unrouted)
N$15  (1 unrouted)
N$16
  Bottom 0.406: DP1.10 219.71,27.94 219.71,34.29 PV1.8 DIP21_40.9
N$17  (1 unrouted)
N$18  (2 unrouted)
N$19  (2 unrouted)
N$20  (1 unrouted)
N$21  (2 unrouted)
N$22  (2 unrouted)
N$23  (2 unrouted)
N$24  (2 unrouted)
N$25  (2 unrouted)
N$26  (2 unrouted)
N$27  (2 unrouted)
N$28  (2 unrouted)
N$29  (2 unrouted)
N$30  (2 unrouted)
N$31  (2 unrouted)
N$32  (2 unrouted)
N$33
  Bottom 0.406: DP1.11 218.44,25.4 218.44,31.75 PV1.9 DIP21_40.8
N$34
  Bottom 0.406: DP1.12 217.17,22.86 217.17,29.21 PV1.10 DIP21_40.7
N$35
  Bottom 0.406: DP1.13 215.9,20.32 215.9,26.67 PV1.11 DIP21_40.6
N$36
  Bottom 0.406: DP1.14 214.63,17.78 214.63,24.13 PV1.12 DIP21_40.5
N$37
  Bottom 0.305: DP1.1 228.6,12.7 224.16,17.14 224.16,22.86 224.16,32.38 221.62,32.38 220.34,33.66 220.34,37.47 219.71,38.1 219.71,43.18 220.98,44.45 DP2.12
N$38
  Bottom 0.305: DP1.2 227.33,15.24 224.79,17.78 224.79,36.83 223.52,38.1 220.98,38.1 220.34,38.73 220.34,40.64 221.62,41.91 DP2.13
N$39
  Bottom 0.305: DP1.3 227.97,17.78 226.06,19.68 226.06,34.92 226.06,36.83 223.52,39.37 DP2.14
N$40
  Bottom 0.406: DP2.11 219.71,46.99 218.44,36.83 PV1.7 DIP21_40.11
N$41
  Bottom 0.406: DP2.10 218.44,49.53 217.17,39.37 PV1.6 DIP21_40.12
N$42
  Bottom 0.305: DP3.10 227.97,29.84 227.97,31.75 231.78,32.38 231.14,35.56 228.6,35.56 227.33,36.83 227.33,41.27 227.97,41.91 DP2.4
N$43
  Bottom 0.305: DP2.5 230.5,44.45 231.78,45.72 234.95,45.72 235.59,45.09 235.59,26.04 234.95,25.4 DP3.11
N$44
  Bottom 0.305: DP1.4 228.6,20.32 227.33,21.59 227.33,22.86 228.6,24.13 232.41,24.13 DP3.12
N$45
  Bottom 0.305: DP3.13 232.41,20.32 DP1.5
N$46
  Bottom 0.305: DP3.14 231.78,19.05 227.97,19.05 226.69,20.32 226.69,24.77 227.33,25.4 DP1.6
N$47
  Bottom 0.305: DP4.14 DP2.3
N$48
  Bottom 0.305: DP2.2 229.24,36.83 227.97,38.1 227.97,40.01 228.6,40.64 232.41,40.64 DP4.13
N$49
  Bottom 0.305: DP2.1 228.6,34.29 226.69,36.2 226.69,41.91 227.97,43.18 232.41,43.18 DP4.12
N$50  (1 unrouted)
  Bottom 0.305: DP4.11 232.41,46.99 230.5,45.72 224.79,45.72
  Bottom 0.406: PV1.5 DIP21_40.13
N$51  (1 unrouted)
  Bottom 0.305: DP4.10 231.78,48.26 219.71,48.26
  Bottom 0.406: PV1.4 DIP21_40.14
N$52
  Bottom 0.305: DP5.12 244.47,22.86 241.3,21.59 238.76,21.59 238.12,20.95 238.12,13.34 238.76,12.7 DP3.1
N$53
  Bottom 0.305: DP3.2 241.3,16.51 245.11,16.51 245.75,18.41 245.75,19.05 245.75,19.68 DP5.13
N$54
  Bottom 0.305: DP3.3 DP5.14
N$55
  Bottom 0.305: DP5.11 246.38,25.4 247.65,26.67 247.65,45.09 247.01,45.72 242.57,45.72 DP4.5
N$56
  Bottom 0.305: DP5.10 247.01,29.21 247.01,31.75 237.49,31.75 236.85,32.38 236.85,40.64 238.12,41.91 DP4.4
N$57
  Bottom 0.305: DP6.14 DP4.3
N$58
  Bottom 0.305: DP6.13 243.84,40.64 239.4,40.64 238.76,40.01 238.76,37.47 239.4,36.83 DP4.2
N$59
  Bottom 0.305: DP4.1 241.94,34.29 243.21,35.56 246.38,35.56 247.01,36.2 247.01,43.81 246.38,44.45 DP6.12
N$60
  Bottom 0.305: DP3.4 241.3,20.95 244.47,21.59 247.01,21.59 248.28,21.59 249.56,21.59 253.37,21.59 DP7.12
N$61
  Bottom 0.305: DP7.13 256.54,20.95 256.54,26.67 252.09,26.67 249.56,26.67 247.01,24.13 243.21,24.13 242.57,24.13 240.66,24.13 DP3.5
N$62  (via drill 0.6)
  Top 0.305: v236.85,16.51 v247.65,16.51
  Bottom 0.305: DP3.6 238.12,25.4 236.85,24.13 236.85,17.14 v236.85,16.51 | DP7.14 254,17.78 252.73,19.05 250.19,19.05 247.97,16.83 | 247.97,16.83 v247.65,16.51 247.97,16.83
N$63
  Bottom 0.305: DP5.3 252.73,17.78 254,16.51 258.44,16.51 259.08,17.78 259.71,40.01 257.81,41.91 DP8.13
N$64
  Bottom 0.305: DP5.5 DP7.11
N$65
  Bottom 0.305: DP5.4 254.63,19.05 257.81,19.05 258.44,19.68 258.44,27.3 257.81,27.94 DP7.10
N$66
  Bottom 0.305: DP5.1 254,12.7 254.63,13.34 258.44,13.34 260.35,15.88 260.99,45.72 259.71,46.99 DP8.11
N$67
  Bottom 0.305: DP5.2 253.37,15.24 254.63,13.97 255.91,13.97 259.71,15.88 260.35,42.55 258.44,44.45 DP8.12
N$68
  Bottom 0.305: DP6.5 254,45.72 254.63,48.26 255.27,48.26 DP8.10
N$69
  Bottom 0.406: DP7.4 04.1
N$70
  Bottom 0.406: DP7.5 04.2
N$71
  Bottom 0.406: DP7.6 04.3
N$72
  Bottom 0.406: 03.2 DP7.1
N$73
  Bottom 0.406: 03.3 DP7.2
N$74
  Bottom 0.406: 03.4 DP7.3
N$75
  Bottom 0.305: 03.1 273.05,10.16 273.05,36.2 273.05,41.27 272.42,41.91 DP8.4
N$76
  Bottom 0.406: 02.3 DP8.2
N$77
  Bottom 0.406: 02.2 DP8.1
N$78
  Bottom 0.406: 02.4 DP8.3
N$79
  Bottom 0.305: DP6.11 244.47,46.99 243.21,48.26 238.12,48.26 236.22,50.16 226.69,50.16 226.06,50.8 217.81,50.8 217.17,50.16 214,46.99 PV1.3
  Bottom 0.406: PV1.3 DIP21_40.15
N$80
  Bottom 0.305: PV1.2 214.63,49.53 219.07,53.98 225.43,53.98 228.6,50.8 243.21,50.8 244.47,49.53 DP6.10
  Bottom 0.406: PV1.2 DIP21_40.16
N$81
  Bottom 0.305: PV1.1 216.53,52.07 220.98,56.52 278.13,56.52 281.31,53.98 281.31,46.35 279.4,44.45 01.1
  Bottom 0.406: PV1.1 DIP21_40.17
N$82  (1 unrouted)
  Bottom 0.305: DP6.4 254,40.64 257.18,40.64 258.44,38.73 258.44,35.56
N$83
  Bottom 0.305: DP6.3 249.56,40.64 249.56,45.09 249.56,45.72 253.37,46.35 254.63,50.8 257.18,50.8 262.25,45.72 266.06,45.72 271.14,50.8 272.42,52.07 01.4
N$84
  Bottom 0.305: DP6.2 250.19,37.47 248.92,40.64 248.92,45.09 248.28,46.35 248.28,46.99 250.19,48.26 252.73,48.26 254,51.44 254.63,53.34 256.54,53.34 257.81,53.34 262.89,48.26 266.06,48.26 271.78,53.34 274.32,53.34 278.13,53.34 280.04,51.44 280.04,50.16 279.4,49.53 01.3
N$85
  Bottom 0.305: DP6.1 248.28,37.47 248.28,45.09 247.01,46.35 247.01,50.16 249.56,50.8 252.73,50.8 252.73,52.07 254.63,53.98 259.71,53.98 259.71,53.34 262.25,50.8 266.06,50.8 269.88,54.61 277.5,54.61 280.67,51.44 280.67,48.26 279.4,46.99 01.2
N$86  (1 unrouted)
  Top 0.305: DP7.8 260.99,31.75 258.44,31.75 252.73,31.75 DP5.8 250.19,31.75 248.92,31.75 241.94,31.75 DP3.8 239.4,31.75 234.95,31.75 231.14,31.75 DP1.8 224.79,30.48 222.88,32.38 220.98,32.38 218.44,34.92 218.44,51.44 221.62,54.61 227.33,54.61 DP2.8
  Bottom 0.406: DP2.8 229.87,55.24 240.66,55.24 | 240.66,55.24 DP4.8 | DP6.8 251.46,55.24 | 251.46,55.24 240.66,55.24 | DP8.8 263.52,55.24 251.46,55.24 | PWR.3 208.28,17.78 208.28,8.89 205.74,8.89 | 205.74,8.89 203.2,8.89 203.2,34.29 DIP21_40.10 | DIP21_40.4 DIP21_40.3 DIP21_40.2 DIP21_40.1 205.74,8.89
N$87  (1 unrouted)
  Top 0.305: DP2.15 223.52,35.56 226.69,35.56 231.78,35.56 DP4.15 234.31,35.56 241.3,35.56 242.57,35.56 DP6.15 245.11,35.56 252.73,35.56 254.63,35.56 DP8.15
  Bottom 0.305: DP7.15 255.91,15.24 DP7.15 | DP7.15 252.73,16.51 250.19,16.51 247.65,15.24 DP5.15 243.21,15.24 242.57,14.61 242.57,12.06 241.94,11.43 238.76,11.43 234.95,15.24 DP3.15 231.78,13.97 231.78,11.43 231.14,10.79 227.97,10.79 223.52,15.24 DP1.15
  Bottom 0.406: DP1.15 PWR.2
N$88  (1 unrouted)
N$89  (2 unrouted)
  Bottom 0.406: IC4.15 26.67,11.43 33.02,11.43 33.02,15.24
N$90  (1 unrouted)
  Top 0.305: DP8.16 254,32.38 252.09,32.38 245.75,32.38 DP6.16 241.94,32.38 234.95,32.38 DP4.16 231.14,32.38 225.43,32.38 224.16,32.38 DP2.16
  Bottom 0.406: 233.68,10.16 222.25,10.16 DP1.16 PWR.1 210.82,9.21 arc-90 210.5,7.62 201.93,7.62 201.93,59.37 arc-90 203.52,59.69 DIP21_40.20 | 233.68,10.16 DP3.16 | DP5.16 245.11,10.16 | 245.11,10.16 233.68,10.16 | DP7.16 256.54,10.16 245.11,10.16
N$91  (2 unrouted)
N$92  (1 unrouted)
N$93
  Bottom 0.406: DD1.19 80.01,50.8 82.55,50.8 84.45,49.53 90.17,49.53 90.17,50.8 | 90.17,50.8 DA1.9 | R1.1 90.17,50.8
N$94  (1 unrouted)
N$95  (1 unrouted)
N$96  (1 unrouted)
N$97  (1 unrouted)
N$98  (1 unrouted)
N$99  (2 unrouted)
N$101  (1 unrouted)
N$102  (1 unrouted)
N$103  (1 unrouted)
N$104  (1 unrouted)
N$105
  Bottom 0.305: DI2.12 181.61,36.83 182.88,38.1 DIP21_1.12
N$106
  Bottom 0.305: DI2.5 173.99,31.75 177.8,35.56 DIP21_1.11
N$107
  Bottom 0.305: DIP21_1.14 184.78,43.18 182.25,45.72 DI1.8
N$108
  Bottom 0.305: DIP21_1.15 185.42,45.72 183.51,47.62 182.88,47.62 182.25,46.99 176.53,46.99 175.26,48.26 DI1.6
N$109
  Bottom 0.305: DI1.12 182.25,55.88 182.88,55.24 182.88,51.44 184.78,49.53 DIP21_1.16
N$110
  Bottom 0.305: DIP21_1.17 183.51,52.07 183.51,59.69 175.26,59.69 DI1.1
N$111
  Bottom 0.305: DI2.9 181.61,29.21 182.88,30.48 DIP21_1.9
N$112
  Bottom 0.305: DI3.1 177.16,22.86 179.07,24.77 182.25,24.77 183.51,26.04 183.51,27.3 184.15,27.94 DIP21_1.8
N$113
  Bottom 0.305: DI3.13 180.97,20.32 182.88,22.23 182.88,23.5 184.78,25.4 DIP21_1.7
N$114
  Bottom 0.305: DIP21_1.6 187.32,22.86 188.59,21.59 188.59,20.32 187.32,19.05 184.78,19.05 183.51,17.78 183.51,8.26 182.88,7.62 DI3.8
N$115  (1 unrouted)
N$116
  Bottom 0.305: DI2.1 175.9,41.91 177.8,43.81 180.97,43.81 184.15,40.64 DIP21_1.13
N$117
  Bottom 0.305: DIP21_1.10 189.23,33.02 189.23,17.78 | 189.23,17.78 DIP21_1.4 | DIP21_1.3 189.23,15.24 | 189.23,15.24 189.23,17.78 | DIP21_1.2 189.23,12.7 | 189.23,12.7 189.23,15.24 | DIP21_1.1 189.23,10.16 189.23,12.7
N$118
  Bottom 0.305: DI1.9 176.34,49.59 | 176.34,49.59 DI1.5 171.45,50.8 169.54,48.9 169.54,41.27 171.45,39.37 DI2.2 | DI1.13 DI1.2 174.62,58.42 176.53,56.52 176.53,49.78 176.34,49.59 | DI2.2 DI2.13 | DI2.8 DI2.6 170.81,29.84 | 170.81,29.84 168.91,30.48 169.54,38.73 DI2.2 | DIP21_1.5 184.78,20.32 182.25,17.78 | DI3.9 182.25,10.16 182.25,17.78 | 170.81,29.84 168.28,27.3 168.28,22.23 170.18,20.32 DI3.2 DI3.12 182.25,17.78
N$119  (1 unrouted)
N$120  (1 unrouted)
N$121  (1 unrouted)
N$122  (1 unrouted)
N$123  (1 unrouted)
N$124  (1 unrouted)
N$125  (1 unrouted)
N$126  (1 unrouted)
N$127  (1 unrouted)
VCC  (11 unrouted)
VDD  (2 unrouted)
VSS  (2 unrouted)
  Bottom 0.305: DI2.7 169.54,24.77

### Text on the board
tPlace: 40 | 40 | 1 | 21 | 20 | 21